# Altium schematic sheet LED_Sheet.SchDoc
size A4; SheetNumber: 2; SheetTotal: 4
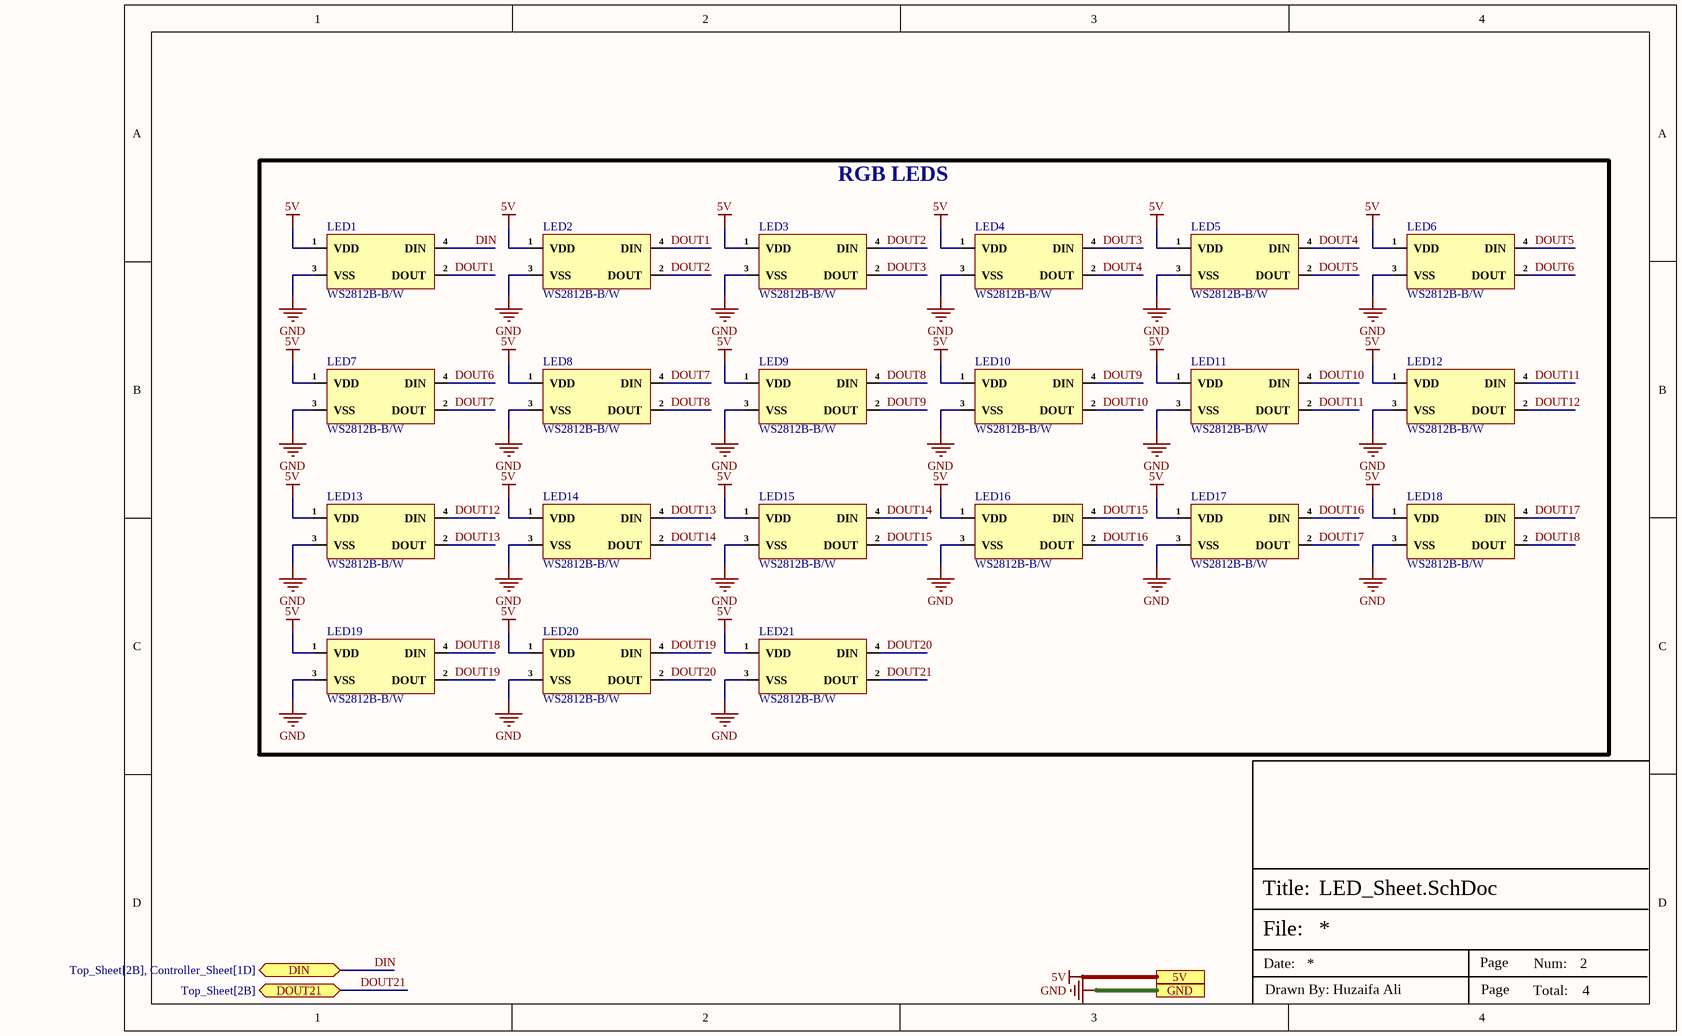
[diagram p0: LED_Sheet.SchDoc]

## Parts
LED1  WS2812B-B/W  [WS2812B-B/W]
LED2  WS2812B-B/W  [WS2812B-B/W]
LED3  WS2812B-B/W  [WS2812B-B/W]
LED4  WS2812B-B/W  [WS2812B-B/W]
LED5  WS2812B-B/W  [WS2812B-B/W]
LED6  WS2812B-B/W  [WS2812B-B/W]
LED7  WS2812B-B/W  [WS2812B-B/W]
LED8  WS2812B-B/W  [WS2812B-B/W]
LED9  WS2812B-B/W  [WS2812B-B/W]
LED10  WS2812B-B/W  [WS2812B-B/W]
LED11  WS2812B-B/W  [WS2812B-B/W]
LED12  WS2812B-B/W  [WS2812B-B/W]
LED13  WS2812B-B/W  [WS2812B-B/W]
LED14  WS2812B-B/W  [WS2812B-B/W]
LED15  WS2812B-B/W  [WS2812B-B/W]
LED16  WS2812B-B/W  [WS2812B-B/W]
LED17  WS2812B-B/W  [WS2812B-B/W]
LED18  WS2812B-B/W  [WS2812B-B/W]
LED19  WS2812B-B/W  [WS2812B-B/W]
LED20  WS2812B-B/W  [WS2812B-B/W]
LED21  WS2812B-B/W  [WS2812B-B/W]

## Blocks framed on the sheet
RGB LEDS: LED1-LED21

## Ports
5V (see Top_Sheet[1B], Controller_Sheet[3D], Power_Sheet[3D]), DIN (bidir, see Top_Sheet[2B], Controller_Sheet[1D]), DOUT21 (bidir, see Top_Sheet[2B]), GND (see Top_Sheet[2B], Controller_Sheet[3D], Power_Sheet[3D])

## Nets
5V: LED1.1(VDD) LED2.1(VDD) LED3.1(VDD) LED4.1(VDD) LED5.1(VDD) LED6.1(VDD) LED7.1(VDD) LED8.1(VDD) LED9.1(VDD) LED10.1(VDD) LED11.1(VDD) LED12.1(VDD) LED13.1(VDD) LED14.1(VDD) LED15.1(VDD) LED16.1(VDD) LED17.1(VDD) LED18.1(VDD) LED19.1(VDD) LED20.1(VDD) LED21.1(VDD) ; port 5V
GND: LED1.3(VSS) LED2.3(VSS) LED3.3(VSS) LED4.3(VSS) LED5.3(VSS) LED6.3(VSS) LED7.3(VSS) LED8.3(VSS) LED9.3(VSS) LED10.3(VSS) LED11.3(VSS) LED12.3(VSS) LED13.3(VSS) LED14.3(VSS) LED15.3(VSS) LED16.3(VSS) LED17.3(VSS) LED18.3(VSS) LED19.3(VSS) LED20.3(VSS) LED21.3(VSS) ; port GND
DIN: LED1.4(DIN) ; port DIN
DOUT1: LED1.2(DOUT) LED2.4(DIN)
DOUT2: LED2.2(DOUT) LED3.4(DIN)
DOUT3: LED3.2(DOUT) LED4.4(DIN)
DOUT4: LED4.2(DOUT) LED5.4(DIN)
DOUT5: LED5.2(DOUT) LED6.4(DIN)
DOUT6: LED6.2(DOUT) LED7.4(DIN)
DOUT7: LED7.2(DOUT) LED8.4(DIN)
DOUT8: LED8.2(DOUT) LED9.4(DIN)
DOUT9: LED9.2(DOUT) LED10.4(DIN)
DOUT10: LED10.2(DOUT) LED11.4(DIN)
DOUT11: LED11.2(DOUT) LED12.4(DIN)
DOUT12: LED12.2(DOUT) LED13.4(DIN)
DOUT13: LED13.2(DOUT) LED14.4(DIN)
DOUT14: LED14.2(DOUT) LED15.4(DIN)
DOUT15: LED15.2(DOUT) LED16.4(DIN)
DOUT16: LED16.2(DOUT) LED17.4(DIN)
DOUT17: LED17.2(DOUT) LED18.4(DIN)
DOUT18: LED18.2(DOUT) LED19.4(DIN)
DOUT19: LED19.2(DOUT) LED20.4(DIN)
DOUT20: LED20.2(DOUT) LED21.4(DIN)
DOUT21: LED21.2(DOUT) ; port DOUT21

## Notes on the sheet
- File:
- Title:
- Date:
- Page
- Num:
- Total:
- Drawn By: Huzaifa Ali

## Library data of the parts
LED1-LED21 = WS2812B-B/W: RGB SMD5050 Light Emitting Diodes (LED) ROHS; Manufacturer: Worldsemi; Item Type: RGB LED; Manufacturer Part Number: WS2812B-B/W; Package: SMD5050; LCSC Part Number: C114586; ComponentLink1Description: LCSC; ComponentLink1URL: https://www.lcsc.com/product-detail/Light-Emitting-Diodes-LED_Worldsemi-WS2812B-B-W_C114586.html